# Altium schematic sheet Top_Sheet.SchDoc
size A; DocumentNumber: 1; SheetNumber: 1; SheetTotal: 8
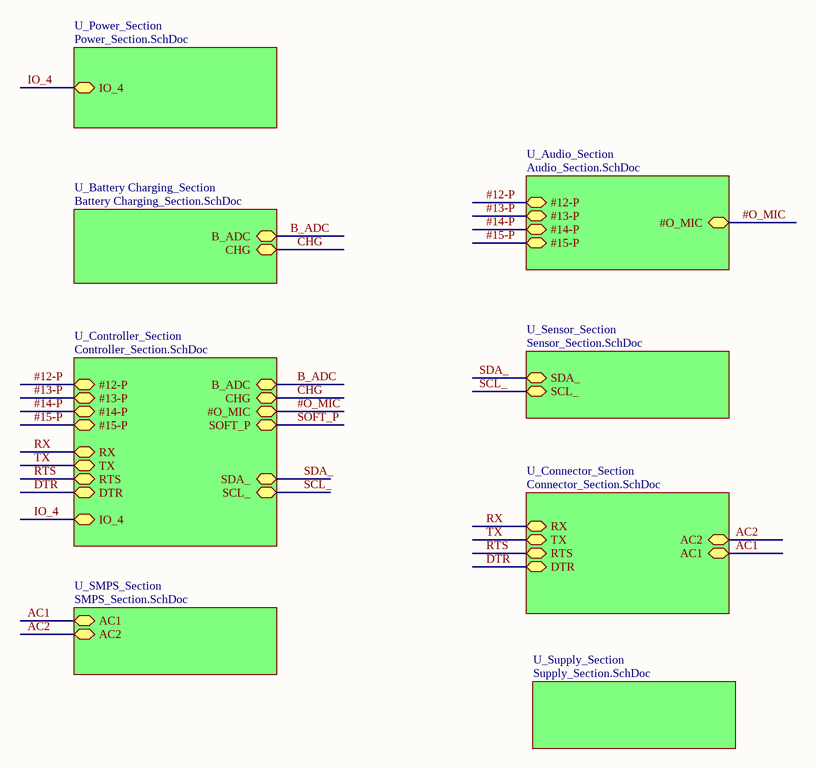
[diagram p0: Top_Sheet.SchDoc]

## Sub-sheets
U_Audio_Section = Audio_Section.SchDoc: #O_MIC (bidir), #13-P (bidir), #14-P (bidir), #12-P (bidir), #15-P (bidir)
U_Battery Charging_Section = Battery Charging_Section.SchDoc: B_ADC (bidir), CHG (bidir)
U_Connector_Section = Connector_Section.SchDoc: TX (bidir), DTR (bidir), RTS (bidir), RX (bidir), AC2 (bidir), AC1 (bidir)
U_Controller_Section = Controller_Section.SchDoc: #15-P (bidir), #14-P (bidir), #12-P (bidir), #13-P (bidir), CHG (bidir), B_ADC (bidir), #O_MIC (bidir), SOFT_P (bidir), RTS (bidir), TX (bidir), DTR (bidir), RX (bidir), SDA_ (bidir), SCL_ (bidir), IO_4 (bidir)
U_Power_Section = Power_Section.SchDoc: IO_4 (bidir)
U_Sensor_Section = Sensor_Section.SchDoc: SDA_ (bidir), SCL_ (bidir)
U_SMPS_Section = SMPS_Section.SchDoc: AC2 (bidir), AC1 (bidir)
U_Supply_Section = Supply_Section.SchDoc: no entries

## Nets
#12-P: sheet U_Controller_Section/#12-P, sheet U_Audio_Section/#12-P
#13-P: sheet U_Controller_Section/#13-P, sheet U_Audio_Section/#13-P
#14-P: sheet U_Controller_Section/#14-P, sheet U_Audio_Section/#14-P
#15-P: sheet U_Controller_Section/#15-P, sheet U_Audio_Section/#15-P
#O_MIC: sheet U_Controller_Section/#O_MIC, sheet U_Audio_Section/#O_MIC
AC1: sheet U_Connector_Section/AC1, sheet U_SMPS_Section/AC1
AC2: sheet U_Connector_Section/AC2, sheet U_SMPS_Section/AC2
B_ADC: sheet U_Controller_Section/B_ADC, sheet U_Battery Charging_Section/B_ADC
CHG: sheet U_Controller_Section/CHG, sheet U_Battery Charging_Section/CHG
DTR: sheet U_Controller_Section/DTR, sheet U_Connector_Section/DTR
IO_4: sheet U_Controller_Section/IO_4, sheet U_Power_Section/IO_4
RTS: sheet U_Controller_Section/RTS, sheet U_Connector_Section/RTS
RX: sheet U_Controller_Section/RX, sheet U_Connector_Section/RX
SCL_: sheet U_Controller_Section/SCL_, sheet U_Sensor_Section/SCL_
SDA_: sheet U_Controller_Section/SDA_, sheet U_Sensor_Section/SDA_
TX: sheet U_Controller_Section/TX, sheet U_Connector_Section/TX